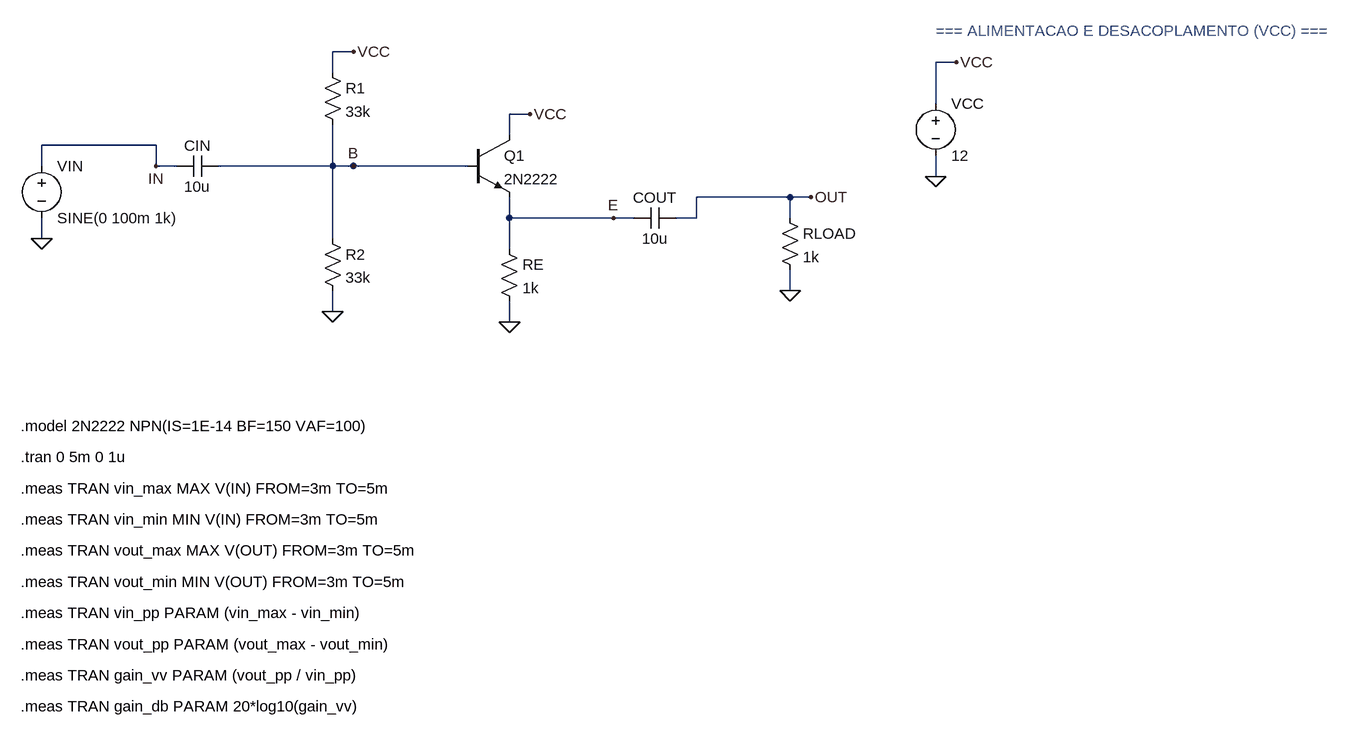
[diagram p0: schematic 02_common_collector.asc]
02_common_collector.asc, the LTspice schematic file:
Version 4
SHEET 1 2592 1280
WIRE 96 368 96 400
WIRE 304 288 272 288
WIRE 368 288 400 288
WIRE 544 144 544 112
WIRE 544 112 576 112
WIRE 544 224 544 400
WIRE 544 288 576 288
WIRE 544 480 544 512
WIRE 752 288 720 288
WIRE 816 240 816 208
WIRE 816 208 848 208
WIRE 816 336 816 416
WIRE 816 368 864 368
WIRE 816 496 816 528
WIRE 1008 368 976 368
WIRE 1072 368 1104 368
WIRE 1248 368 1248 336
WIRE 1248 336 1280 336
WIRE 1248 448 1248 480
WIRE 1472 192 1472 128
WIRE 1472 272 1472 304
WIRE 1472 128 1504 128
WIRE 96 288 96 256
WIRE 96 256 128 256
WIRE 864 368 976 368
WIRE 128 256 272 256
WIRE 272 256 272 288
WIRE 1104 368 1104 336
WIRE 1104 336 1280 336
WIRE 400 288 576 288
WIRE 576 288 720 288
FLAG 96 400 0
FLAG 272 288 IN
FLAG 576 112 VCC
FLAG 576 288 B
FLAG 544 512 0
FLAG 848 208 VCC
FLAG 816 528 0
FLAG 976 368 E
FLAG 1280 336 OUT
FLAG 1248 480 0
FLAG 1472 304 0
FLAG 1504 128 VCC
SYMBOL voltage 96 272 R0
WINDOW 3 24 96 Left 2
SYMATTR InstName VIN
SYMATTR Value SINE(0 100m 1k)
SYMBOL cap 368 272 R90
WINDOW 0 0 32 VBottom 2
WINDOW 3 32 32 VTop 2
SYMATTR InstName CIN
SYMATTR Value 10u
SYMBOL res 528 128 R0
SYMATTR InstName R1
SYMATTR Value 33k
SYMBOL res 528 384 R0
SYMATTR InstName R2
SYMATTR Value 33k
SYMBOL npn 752 240 R0
SYMATTR InstName Q1
SYMATTR Value 2N2222
SYMBOL res 800 400 R0
SYMATTR InstName RE
SYMATTR Value 1k
SYMBOL cap 1072 352 R90
WINDOW 0 0 32 VBottom 2
WINDOW 3 32 32 VTop 2
SYMATTR InstName COUT
SYMATTR Value 10u
SYMBOL res 1232 352 R0
SYMATTR InstName RLOAD
SYMATTR Value 1k
SYMBOL voltage 1472 176 R0
WINDOW 3 24 96 Left 2
SYMATTR InstName VCC
SYMATTR Value 12
TEXT 1472 80 Left 2 ;=== ALIMENTACAO E DESACOPLAMENTO (VCC) ===
TEXT 64 688 Left 2 !.model 2N2222 NPN(IS=1E-14 BF=150 VAF=100)
TEXT 64 736 Left 2 !.tran 0 5m 0 1u
TEXT 64 784 Left 2 !.meas TRAN vin_max MAX V(IN) FROM=3m TO=5m
TEXT 64 832 Left 2 !.meas TRAN vin_min MIN V(IN) FROM=3m TO=5m
TEXT 64 880 Left 2 !.meas TRAN vout_max MAX V(OUT) FROM=3m TO=5m
TEXT 64 928 Left 2 !.meas TRAN vout_min MIN V(OUT) FROM=3m TO=5m
TEXT 64 976 Left 2 !.meas TRAN vin_pp PARAM (vin_max - vin_min)
TEXT 64 1024 Left 2 !.meas TRAN vout_pp PARAM (vout_max - vout_min)
TEXT 64 1072 Left 2 !.meas TRAN gain_vv PARAM (vout_pp / vin_pp)
TEXT 64 1120 Left 2 !.meas TRAN gain_db PARAM 20*log10(gain_vv)

The netlist it stands for:
* 02_common_collector.asc
VIN IN 0 SINE(0 100m 1k)
CIN B IN 10u
R1 VCC B 33k
R2 B 0 33k
Q1 VCC B E 0 2N2222
RE E 0 1k
COUT OUT E 10u
RLOAD OUT 0 1k
VCC VCC 0 12
.model NPN NPN
.model PNP PNP
.lib standard.bjt
* === ALIMENTACAO E DESACOPLAMENTO (VCC) ===
.model 2N2222 NPN(IS=1E-14 BF=150 VAF=100)
.tran 0 5m 0 1u
.meas TRAN vin_max MAX V(IN) FROM=3m TO=5m
.meas TRAN vin_min MIN V(IN) FROM=3m TO=5m
.meas TRAN vout_max MAX V(OUT) FROM=3m TO=5m
.meas TRAN vout_min MIN V(OUT) FROM=3m TO=5m
.meas TRAN vin_pp PARAM (vin_max - vin_min)
.meas TRAN vout_pp PARAM (vout_max - vout_min)
.meas TRAN gain_vv PARAM (vout_pp / vin_pp)
.meas TRAN gain_db PARAM 20*log10(gain_vv)
.backanno
.end